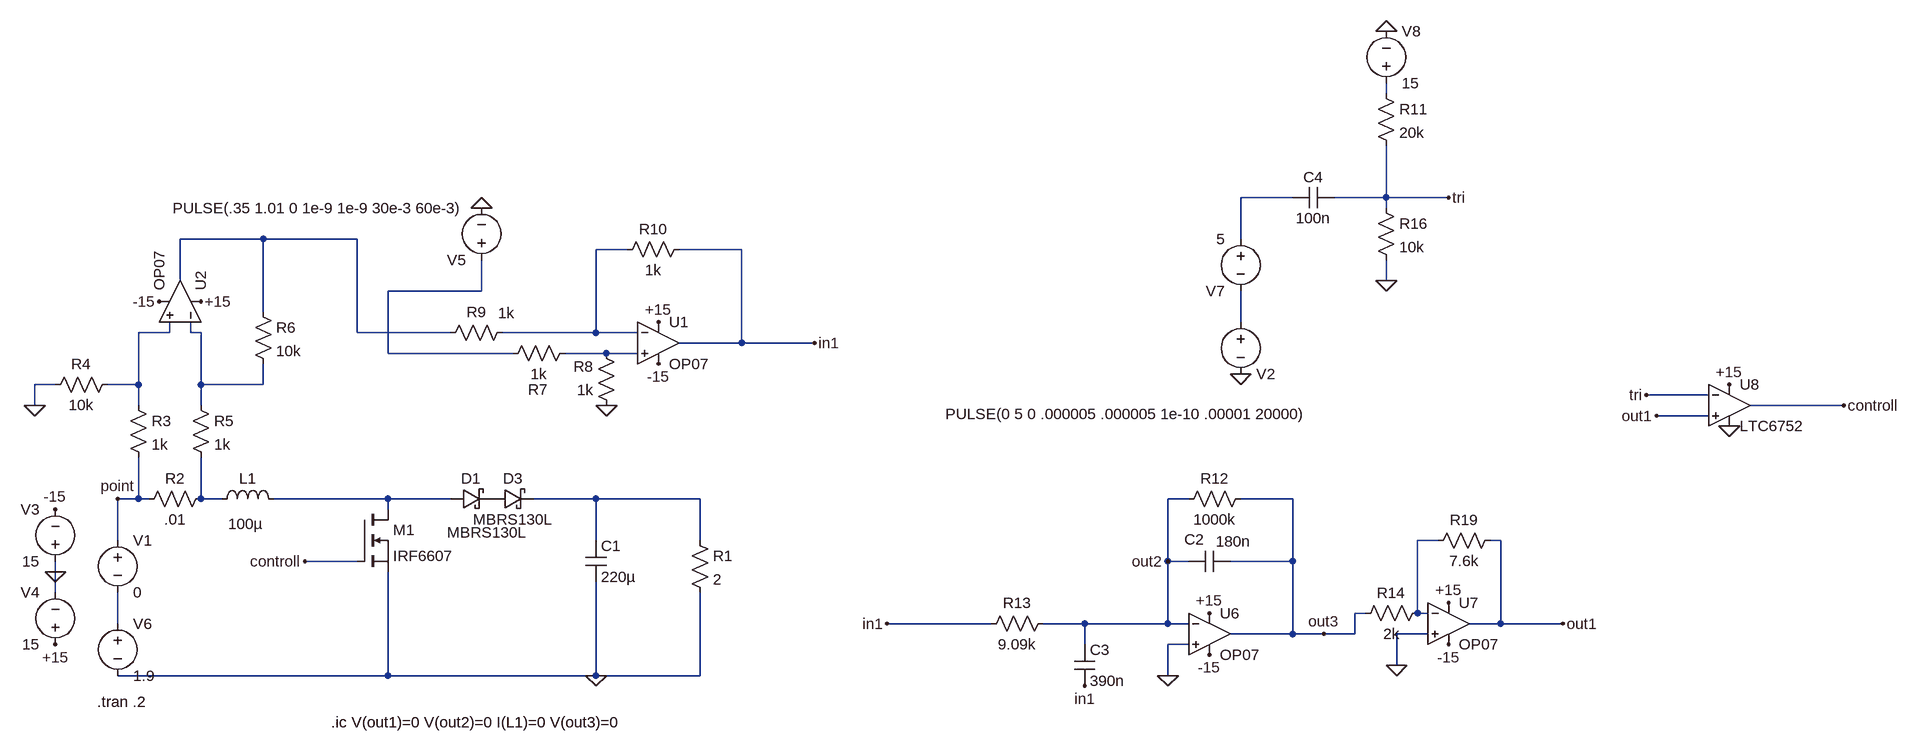
[diagram p0: schematic boost.asc]
boost.asc, the LTspice schematic file:
Version 4
SHEET 1 3364 1184
WIRE 1600 -576 1600 -592
WIRE 1456 -416 1376 -416
WIRE 1600 -416 1600 -496
WIRE 1600 -416 1520 -416
WIRE 1696 -416 1600 -416
WIRE 1600 -400 1600 -416
WIRE -128 -352 -256 -352
WIRE 16 -352 -128 -352
WIRE 1376 -352 1376 -416
WIRE 432 -336 384 -336
WIRE 608 -336 512 -336
WIRE -256 -288 -256 -352
WIRE 1600 -288 1600 -320
WIRE 208 -272 208 -320
WIRE 208 -272 64 -272
WIRE -128 -240 -128 -352
WIRE 1376 -224 1376 -272
WIRE -272 -208 -272 -224
WIRE -272 -208 -320 -208
WIRE -240 -208 -240 -224
WIRE -224 -208 -240 -208
WIRE 16 -208 16 -352
WIRE 160 -208 16 -208
WIRE 384 -208 384 -336
WIRE 384 -208 240 -208
WIRE 448 -208 384 -208
WIRE 608 -192 608 -336
WIRE 608 -192 512 -192
WIRE 720 -192 608 -192
WIRE 64 -176 64 -272
WIRE 256 -176 64 -176
WIRE 400 -176 336 -176
WIRE 448 -176 400 -176
WIRE -448 -128 -480 -128
WIRE -320 -128 -320 -208
WIRE -320 -128 -368 -128
WIRE -224 -128 -224 -208
WIRE -128 -128 -128 -160
WIRE -128 -128 -224 -128
WIRE 2096 -112 2000 -112
WIRE -480 -96 -480 -128
WIRE -320 -96 -320 -128
WIRE -224 -96 -224 -128
WIRE 2304 -96 2160 -96
WIRE 2096 -80 2016 -80
WIRE -320 48 -320 -16
WIRE -320 48 -352 48
WIRE -304 48 -320 48
WIRE -224 48 -224 -16
WIRE -192 48 -224 48
WIRE 64 48 -112 48
WIRE 160 48 64 48
WIRE 384 48 288 48
WIRE 544 48 384 48
WIRE 1296 48 1264 48
WIRE 1456 48 1376 48
WIRE 64 64 64 48
WIRE -352 112 -352 48
WIRE 384 112 384 48
WIRE 544 112 544 48
WIRE 1680 112 1648 112
WIRE 1776 112 1760 112
WIRE 16 144 -64 144
WIRE 1264 144 1264 48
WIRE 1296 144 1264 144
WIRE 1456 144 1456 48
WIRE 1456 144 1360 144
WIRE -448 160 -448 144
WIRE -448 192 -448 160
WIRE 1568 224 1552 224
WIRE 1648 224 1648 112
WIRE 1664 224 1648 224
WIRE -352 240 -352 192
WIRE 992 240 832 240
WIRE 1136 240 1072 240
WIRE 1264 240 1264 144
WIRE 1264 240 1136 240
WIRE 1296 240 1264 240
WIRE 1776 240 1776 112
WIRE 1776 240 1728 240
WIRE 1872 240 1776 240
WIRE 1456 256 1456 144
WIRE 1456 256 1360 256
WIRE 1504 256 1456 256
WIRE 1552 256 1552 224
WIRE 1552 256 1504 256
WIRE 1664 256 1616 256
WIRE 1136 272 1136 240
WIRE 1296 272 1264 272
WIRE 1616 304 1616 256
WIRE 64 320 64 160
WIRE 64 320 -352 320
WIRE 384 320 384 176
WIRE 384 320 64 320
WIRE 544 320 544 192
WIRE 544 320 384 320
WIRE 1264 320 1264 272
FLAG 384 320 0
FLAG 208 -400 0
FLAG -480 -96 0
FLAG -448 272 +15
FLAG -448 64 -15
FLAG -448 160 0
FLAG 480 -224 +15
FLAG -224 -256 +15
FLAG 480 -160 -15
FLAG -288 -256 -15
FLAG 400 -96 0
FLAG 2304 -96 controll
FLAG -64 144 controll
FLAG -352 48 point
FLAG 720 -192 in1
FLAG 1264 320 0
FLAG 832 240 in1
FLAG 1872 240 out1
FLAG 1328 224 +15
FLAG 1328 288 -15
FLAG 1264 144 out2
FLAG 1696 208 +15
FLAG 1696 272 -15
FLAG 1616 304 0
FLAG 2128 -64 0
FLAG 2128 -128 +15
FLAG 2016 -80 out1
FLAG 1504 256 out3
FLAG 1136 336 in1
FLAG 1376 -144 0
FLAG 1696 -416 tri
FLAG 2000 -112 tri
FLAG 1600 -288 0
FLAG 1600 -672 0
SYMBOL ind -208 64 R270
WINDOW 0 32 56 VTop 2
WINDOW 3 -7 53 VBottom 2
SYMATTR InstName L1
SYMATTR Value 100µ
SYMBOL schottky 160 64 R270
WINDOW 0 32 32 VTop 2
WINDOW 3 -20 56 VBottom 2
SYMATTR InstName D1
SYMATTR Value MBRS130L
SYMATTR Description Diode
SYMATTR Type diode
SYMBOL cap 368 112 R0
SYMATTR InstName C1
SYMATTR Value 220µ
SYMBOL res 528 96 R0
SYMATTR InstName R1
SYMATTR Value 2
SYMBOL voltage -352 96 R0
WINDOW 123 0 0 Left 0
WINDOW 39 0 0 Left 0
SYMATTR InstName V1
SYMATTR Value 0
SYMBOL nmos 16 64 R0
SYMATTR InstName M1
SYMATTR Value IRF6607
SYMBOL res -208 32 R90
WINDOW 0 0 56 VBottom 2
WINDOW 3 32 56 VTop 2
SYMATTR InstName R2
SYMATTR Value .01
SYMBOL Opamps\\OP07 480 -256 R0
SYMATTR InstName U1
SYMBOL voltage -448 160 R180
WINDOW 0 24 96 Left 2
WINDOW 3 24 16 Left 2
WINDOW 123 0 0 Left 0
WINDOW 39 0 0 Left 0
SYMATTR InstName V3
SYMATTR Value 15
SYMBOL voltage -448 288 R180
WINDOW 0 24 96 Left 2
WINDOW 3 24 16 Left 2
WINDOW 123 0 0 Left 0
WINDOW 39 0 0 Left 0
SYMATTR InstName V4
SYMATTR Value 15
SYMBOL voltage 208 -304 R180
WINDOW 123 0 0 Left 0
WINDOW 39 0 0 Left 0
SYMATTR InstName V5
SYMATTR Value PULSE(.35 1.01 0 1e-9 1e-9 30e-3 60e-3)
SYMBOL res -336 -112 R0
SYMATTR InstName R3
SYMATTR Value 1k
SYMBOL res -352 -144 R90
WINDOW 0 0 56 VBottom 2
WINDOW 3 32 56 VTop 2
SYMATTR InstName R4
SYMATTR Value 10k
SYMBOL res -240 -112 R0
SYMATTR InstName R5
SYMATTR Value 1k
SYMBOL Opamps\\OP07 -192 -256 M270
SYMATTR InstName U2
SYMBOL res -144 -256 R0
SYMATTR InstName R6
SYMATTR Value 10k
SYMBOL res 352 -192 R90
WINDOW 0 87 57 VBottom 2
WINDOW 3 32 56 VTop 2
SYMATTR InstName R7
SYMATTR Value 1k
SYMBOL res 416 -80 R180
WINDOW 0 36 76 Left 2
WINDOW 3 36 40 Left 2
SYMATTR InstName R8
SYMATTR Value 1k
SYMBOL res 256 -224 R90
WINDOW 0 0 56 VBottom 2
WINDOW 3 -30 10 VTop 2
SYMATTR InstName R9
SYMATTR Value 1k
SYMBOL res 528 -352 R90
WINDOW 0 0 56 VBottom 2
WINDOW 3 32 56 VTop 2
SYMATTR InstName R10
SYMATTR Value 1k
SYMBOL schottky 224 64 R270
WINDOW 0 32 32 VTop 2
WINDOW 3 0 32 VBottom 2
SYMATTR InstName D3
SYMATTR Value MBRS130L
SYMATTR Description Diode
SYMATTR Type diode
SYMBOL Opamps\\OP07 1328 192 R0
SYMATTR InstName U6
SYMBOL cap 1360 128 R90
WINDOW 0 -2 55 VBottom 2
WINDOW 3 -30 -5 VTop 2
SYMATTR InstName C2
SYMATTR Value 180n
SYMBOL res 1392 32 R90
WINDOW 0 0 56 VBottom 2
WINDOW 3 32 56 VTop 2
SYMATTR InstName R12
SYMATTR Value 1000k
SYMBOL res 1088 224 R90
WINDOW 0 0 56 VBottom 2
WINDOW 3 32 56 VTop 2
SYMATTR InstName R13
SYMATTR Value 9.09k
SYMBOL voltage -352 224 R0
WINDOW 123 0 0 Left 0
WINDOW 39 0 0 Left 0
SYMATTR InstName V6
SYMATTR Value 1.9
SYMBOL Opamps\\OP07 1696 176 R0
SYMATTR InstName U7
SYMBOL res 1664 208 R90
WINDOW 0 0 56 VBottom 2
WINDOW 3 32 56 VTop 2
SYMATTR InstName R14
SYMATTR Value 2k
SYMBOL res 1776 96 R90
WINDOW 0 0 56 VBottom 2
WINDOW 3 32 56 VTop 2
SYMATTR InstName R19
SYMATTR Value 7.6k
SYMBOL Comparators\\LTC6752 2128 -160 R0
SYMATTR InstName U8
SYMBOL cap 1120 272 R0
SYMATTR InstName C3
SYMATTR Value 390n
SYMBOL voltage 1376 -240 R0
WINDOW 0 24 96 Left 2
WINDOW 3 -454 157 Left 2
WINDOW 123 0 0 Left 0
WINDOW 39 0 0 Left 0
SYMATTR InstName V2
SYMATTR Value PULSE(0 5 0 .000005 .000005 1e-10 .00001 20000)
SYMBOL voltage 1376 -368 M0
WINDOW 0 24 96 Left 2
WINDOW 3 24 16 Left 2
WINDOW 123 0 0 Left 0
WINDOW 39 0 0 Left 0
SYMATTR InstName V7
SYMATTR Value 5
SYMBOL cap 1520 -432 R90
WINDOW 0 0 32 VBottom 2
WINDOW 3 32 32 VTop 2
SYMATTR InstName C4
SYMATTR Value 100n
SYMBOL res 1584 -416 R0
SYMATTR InstName R16
SYMATTR Value 10k
SYMBOL voltage 1600 -576 M180
WINDOW 0 24 96 Left 2
WINDOW 3 24 16 Left 2
WINDOW 123 0 0 Left 0
WINDOW 39 0 0 Left 0
SYMATTR InstName V8
SYMATTR Value 15
SYMBOL res 1584 -592 R0
SYMATTR InstName R11
SYMATTR Value 20k
TEXT -384 360 Left 2 !.tran .2
TEXT -24 392 Left 2 !.ic V(out1)=0 V(out2)=0 I(L1)=0 V(out3)=0

The netlist it stands for:
* boost.asc
L1 N010 N011 100µ
D1 N011 P001 MBRS130L
C1 N012 0 220µ
R1 N012 0 2
V1 point N014 0
M1 N011 controll 0 0 IRF6607
R2 N010 point .01
XU1 N009 N004 +15 -15 in1 LT1001  ; OP07, pins In+ In- V+ V- OUT
V3 0 -15 15
V4 +15 0 15
V5 N005 0 PULSE(.35 1.01 0 1e-9 1e-9 30e-3 60e-3)
R3 N007 point 1k
R4 N007 0 10k
R5 N008 N010 1k
XU2 N007 N008 +15 -15 N003 LT1001  ; OP07, pins In+ In- V+ V- OUT
R6 N003 N008 10k
R7 N009 N005 1k
R8 0 N009 1k
R9 N004 N003 1k
R10 in1 N004 1k
D3 P001 N012 MBRS130L
XU6 0 out2 +15 -15 out3 LT1001  ; OP07, pins In+ In- V+ V- OUT
C2 out3 out2 180n
R12 out3 out2 1000k
R13 out2 in1 9.09k
V6 N014 0 1.9
XU7 0 N013 +15 -15 out1 LT1001  ; OP07, pins In+ In- V+ V- OUT
R14 N013 out3 2k
R19 out1 N013 7.6k
XU8 out1 tri +15 0 controll LTC6752  ; pins In+ In- V+ V- OUT
C3 out2 in1 390n
V2 N006 0 PULSE(0 5 0 .000005 .000005 1e-10 .00001 20000)
V7 N002 N006 5
C4 tri N002 100n
R16 tri 0 10k
V8 N001 0 15
R11 N001 tri 20k
.model D D
.lib standard.dio
.model NMOS NMOS
.model PMOS PMOS
.lib standard.mos
.tran .2
.ic V(out1)=0 V(out2)=0 I(L1)=0 V(out3)=0
.lib LTC.lib
.lib LTC7.lib
.backanno
.end